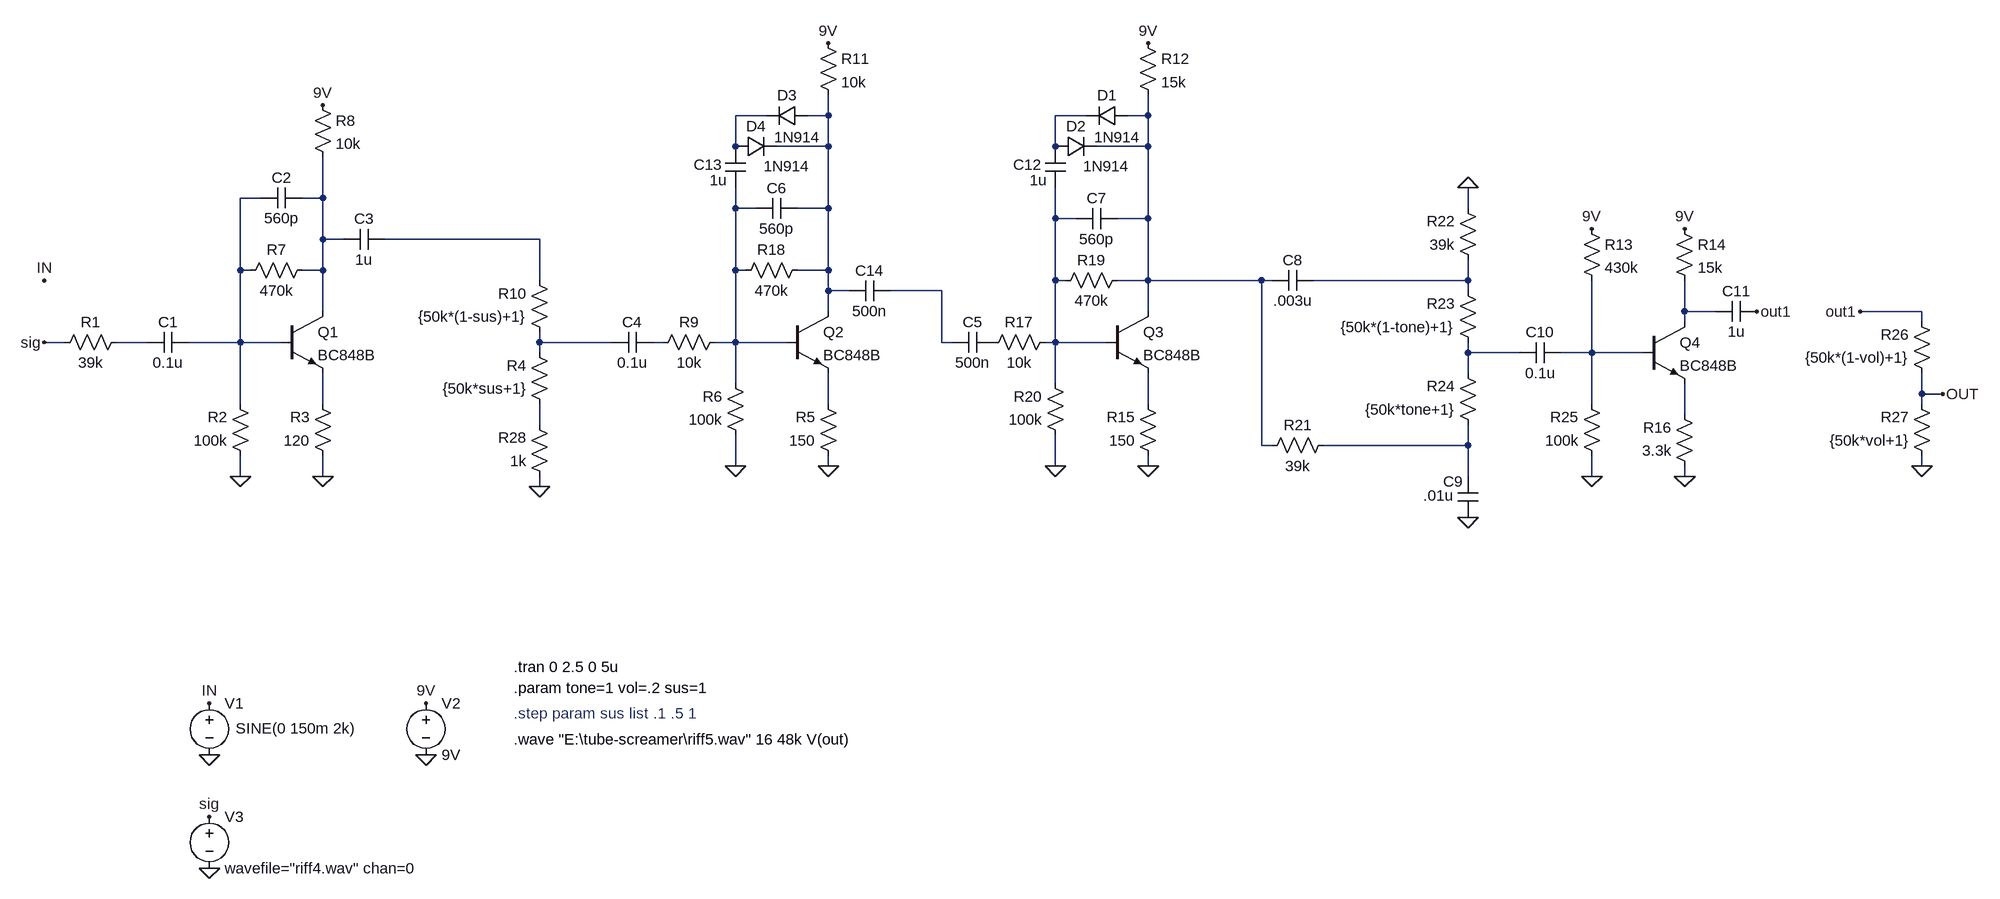
[diagram p0: schematic BigMuffPi.asc]
BigMuffPi.asc, the LTspice schematic file:
Version 4.1
SHEET 1 2532 1044
WIRE 640 -144 592 -144
WIRE 736 -144 736 -176
WIRE 736 -144 704 -144
WIRE 1136 -144 1088 -144
WIRE 1232 -144 1232 -176
WIRE 1232 -144 1200 -144
WIRE 592 -96 592 -144
WIRE 736 -96 736 -144
WIRE 736 -96 656 -96
WIRE 1088 -96 1088 -144
WIRE 1232 -96 1232 -144
WIRE 1232 -96 1152 -96
WIRE -144 -16 -176 -16
WIRE -48 -16 -48 -80
WIRE -48 -16 -80 -16
WIRE 592 0 592 -32
WIRE 624 0 592 0
WIRE 736 0 736 -96
WIRE 736 0 688 0
WIRE 1728 0 1728 -32
WIRE 1088 16 1088 -32
WIRE 1120 16 1088 16
WIRE 1232 16 1232 -96
WIRE 1232 16 1184 16
WIRE -48 48 -48 -16
WIRE -16 48 -48 48
WIRE 288 48 48 48
WIRE -176 96 -176 -16
WIRE -160 96 -176 96
WIRE -48 96 -48 48
WIRE -48 96 -80 96
WIRE 592 96 592 0
WIRE 608 96 592 96
WIRE 736 96 736 0
WIRE 736 96 688 96
WIRE 288 112 288 48
WIRE 1088 112 1088 16
WIRE 1104 112 1088 112
WIRE 1232 112 1232 16
WIRE 1232 112 1184 112
WIRE 1408 112 1232 112
WIRE 1424 112 1408 112
WIRE 1728 112 1728 80
WIRE 1728 112 1488 112
WIRE 736 128 736 96
WIRE 768 128 736 128
WIRE 912 128 832 128
WIRE 1728 128 1728 112
WIRE -48 160 -48 96
WIRE 736 160 736 128
WIRE 1232 160 1232 112
WIRE 2064 160 2064 112
WIRE 2112 160 2064 160
WIRE 2432 160 2336 160
WIRE 2064 176 2064 160
WIRE 2432 176 2432 160
WIRE -448 208 -480 208
WIRE -320 208 -368 208
WIRE -176 208 -176 96
WIRE -176 208 -256 208
WIRE -112 208 -176 208
WIRE 288 208 288 192
WIRE 400 208 288 208
WIRE 480 208 464 208
WIRE 592 208 592 96
WIRE 592 208 560 208
WIRE 672 208 592 208
WIRE 912 208 912 128
WIRE 928 208 912 208
WIRE 1088 208 1088 112
WIRE 1088 208 1072 208
WIRE 1168 208 1088 208
WIRE 288 224 288 208
WIRE 1728 224 1728 208
WIRE 1808 224 1728 224
WIRE 1920 224 1920 112
WIRE 1920 224 1872 224
WIRE 2000 224 1920 224
WIRE 1728 256 1728 224
WIRE 592 272 592 208
WIRE 1088 272 1088 208
WIRE 2432 288 2432 256
WIRE 2464 288 2432 288
WIRE -176 304 -176 208
WIRE -48 304 -48 256
WIRE 736 304 736 256
WIRE 1232 304 1232 256
WIRE 1920 304 1920 224
WIRE 2432 304 2432 288
WIRE 2064 320 2064 272
WIRE 288 336 288 304
WIRE 1408 368 1408 112
WIRE 1424 368 1408 368
WIRE 1728 368 1728 336
WIRE 1728 368 1504 368
WIRE 592 400 592 352
WIRE 736 400 736 384
WIRE 1088 400 1088 352
WIRE 1232 400 1232 384
WIRE 2432 400 2432 384
WIRE -176 416 -176 384
WIRE -48 416 -48 384
WIRE 1728 416 1728 368
WIRE 1920 416 1920 384
WIRE 2064 416 2064 400
WIRE 288 432 288 416
FLAG -176 416 0
FLAG -48 416 0
FLAG 288 432 0
FLAG -48 -160 9V
FLAG 736 -256 9V
FLAG 1232 -256 9V
FLAG 1920 32 9V
FLAG 2064 32 9V
FLAG 1232 400 0
FLAG 2064 416 0
FLAG 736 400 0
FLAG 592 400 0
FLAG 1088 400 0
FLAG 1728 -32 0
FLAG 1728 480 0
FLAG 1920 416 0
FLAG 2432 400 0
FLAG 2464 288 OUT
FLAG -480 112 IN
FLAG -224 768 IN
FLAG -224 848 0
FLAG 112 768 9V
FLAG 112 848 0
FLAG -224 1024 0
FLAG -224 944 sig
FLAG -480 208 sig
FLAG 2336 160 out1
FLAG 2176 160 out1
SYMBOL npn3 672 160 R0
SYMATTR InstName Q2
SYMATTR Value BC848B
SYMBOL npn3 1168 160 R0
SYMATTR InstName Q3
SYMATTR Value BC848B
SYMBOL npn3 2000 176 R0
SYMATTR InstName Q4
SYMATTR Value BC848B
SYMBOL res -352 192 R90
WINDOW 0 0 56 VBottom 2
WINDOW 3 32 56 VTop 2
SYMATTR InstName R1
SYMATTR Value 39k
SYMBOL res -160 400 R180
WINDOW 0 36 76 Left 2
WINDOW 3 36 40 Left 2
SYMATTR InstName R2
SYMATTR Value 100k
SYMBOL res -32 400 R180
WINDOW 0 36 76 Left 2
WINDOW 3 36 40 Left 2
SYMATTR InstName R3
SYMATTR Value 120
SYMBOL res 304 320 R180
WINDOW 0 36 76 Left 2
WINDOW 3 36 40 Left 2
SYMATTR InstName R4
SYMATTR Value {50k*sus+1}
SYMBOL res 752 400 R180
WINDOW 0 36 76 Left 2
WINDOW 3 36 40 Left 2
SYMATTR InstName R5
SYMATTR Value 150
SYMBOL res 608 368 R180
WINDOW 0 36 76 Left 2
WINDOW 3 36 40 Left 2
SYMATTR InstName R6
SYMATTR Value 100k
SYMBOL res -176 112 R270
WINDOW 0 32 56 VTop 2
WINDOW 3 0 56 VBottom 2
SYMATTR InstName R7
SYMATTR Value 470k
SYMBOL res -64 -176 R0
SYMATTR InstName R8
SYMATTR Value 10k
SYMBOL res 576 192 R90
WINDOW 0 0 56 VBottom 2
WINDOW 3 32 56 VTop 2
SYMATTR InstName R9
SYMATTR Value 10k
SYMBOL cap -256 192 R90
WINDOW 0 0 32 VBottom 2
WINDOW 3 32 32 VTop 2
SYMATTR InstName C1
SYMATTR Value 0.1u
SYMBOL cap -80 -32 R90
WINDOW 0 0 32 VBottom 2
WINDOW 3 32 32 VTop 2
SYMATTR InstName C2
SYMATTR Value 560p
SYMBOL cap 48 32 R90
WINDOW 0 0 32 VBottom 2
WINDOW 3 32 32 VTop 2
SYMATTR InstName C3
SYMATTR Value 1u
SYMBOL cap 464 192 R90
WINDOW 0 0 32 VBottom 2
WINDOW 3 32 32 VTop 2
SYMATTR InstName C4
SYMATTR Value 0.1u
SYMBOL res 304 208 R180
WINDOW 0 36 76 Left 2
WINDOW 3 36 40 Left 2
SYMATTR InstName R10
SYMATTR Value {50k*(1-sus)+1}
SYMBOL res 720 -272 R0
SYMATTR InstName R11
SYMATTR Value 10k
SYMBOL res 1216 -272 R0
SYMATTR InstName R12
SYMATTR Value 15k
SYMBOL res 1904 16 R0
SYMATTR InstName R13
SYMATTR Value 430k
SYMBOL res 2048 16 R0
SYMATTR InstName R14
SYMATTR Value 15k
SYMBOL res 1248 400 R180
WINDOW 0 36 76 Left 2
WINDOW 3 36 40 Left 2
SYMATTR InstName R15
SYMATTR Value 150
SYMBOL res 2080 416 R180
WINDOW 0 36 76 Left 2
WINDOW 3 36 40 Left 2
SYMATTR InstName R16
SYMATTR Value 3.3k
SYMBOL res 1088 192 R90
WINDOW 0 0 56 VBottom 2
WINDOW 3 32 56 VTop 2
SYMATTR InstName R17
SYMATTR Value 10k
SYMBOL cap 992 192 R90
WINDOW 0 0 32 VBottom 2
WINDOW 3 32 32 VTop 2
SYMATTR InstName C5
SYMATTR Value 500n
SYMBOL res 592 112 R270
WINDOW 0 32 56 VTop 2
WINDOW 3 0 56 VBottom 2
SYMATTR InstName R18
SYMATTR Value 470k
SYMBOL cap 688 -16 R90
WINDOW 0 0 32 VBottom 2
WINDOW 3 32 32 VTop 2
SYMATTR InstName C6
SYMATTR Value 560p
SYMBOL res 1088 128 R270
WINDOW 0 32 56 VTop 2
WINDOW 3 0 56 VBottom 2
SYMATTR InstName R19
SYMATTR Value 470k
SYMBOL cap 1184 0 R90
WINDOW 0 0 32 VBottom 2
WINDOW 3 32 32 VTop 2
SYMATTR InstName C7
SYMATTR Value 560p
SYMBOL res 1104 368 R180
WINDOW 0 36 76 Left 2
WINDOW 3 36 40 Left 2
SYMATTR InstName R20
SYMATTR Value 100k
SYMBOL res 1520 352 R90
WINDOW 0 0 56 VBottom 2
WINDOW 3 32 56 VTop 2
SYMATTR InstName R21
SYMATTR Value 39k
SYMBOL cap 1488 96 R90
WINDOW 0 0 32 VBottom 2
WINDOW 3 32 32 VTop 2
SYMATTR InstName C8
SYMATTR Value .003u
SYMBOL res 1744 96 R180
WINDOW 0 36 76 Left 2
WINDOW 3 36 40 Left 2
SYMATTR InstName R22
SYMATTR Value 39k
SYMBOL res 1744 224 R180
WINDOW 0 36 76 Left 2
WINDOW 3 36 40 Left 2
SYMATTR InstName R23
SYMATTR Value {50k*(1-tone)+1}
SYMBOL res 1744 352 R180
WINDOW 0 36 76 Left 2
WINDOW 3 36 40 Left 2
SYMATTR InstName R24
SYMATTR Value {50k*tone+1}
SYMBOL cap 1744 480 R180
WINDOW 0 24 56 Left 2
WINDOW 3 38 34 Left 2
SYMATTR InstName C9
SYMATTR Value .01u
SYMBOL cap 1872 208 R90
WINDOW 0 0 32 VBottom 2
WINDOW 3 32 32 VTop 2
SYMATTR InstName C10
SYMATTR Value 0.1u
SYMBOL res 1936 400 R180
WINDOW 0 36 76 Left 2
WINDOW 3 36 40 Left 2
SYMATTR InstName R25
SYMATTR Value 100k
SYMBOL cap 2176 144 R90
WINDOW 0 0 32 VBottom 2
WINDOW 3 32 32 VTop 2
SYMATTR InstName C11
SYMATTR Value 1u
SYMBOL res 2448 272 R180
WINDOW 0 36 76 Left 2
WINDOW 3 36 40 Left 2
SYMATTR InstName R26
SYMATTR Value {50k*(1-vol)+1}
SYMBOL res 2448 400 R180
WINDOW 0 36 76 Left 2
WINDOW 3 36 40 Left 2
SYMATTR InstName R27
SYMATTR Value {50k*vol+1}
SYMBOL diode 1200 -160 R90
WINDOW 0 0 32 VBottom 2
WINDOW 3 34 16 VTop 2
SYMATTR InstName D1
SYMATTR Value 1N914
SYMBOL diode 1088 -80 R270
WINDOW 0 32 32 VTop 2
WINDOW 3 1 79 VBottom 2
SYMATTR InstName D2
SYMATTR Value 1N914
SYMBOL cap 1072 -96 R0
WINDOW 0 -49 28 Left 2
WINDOW 3 -24 52 Left 2
SYMATTR InstName C12
SYMATTR Value 1u
SYMBOL diode 704 -160 R90
WINDOW 0 0 32 VBottom 2
WINDOW 3 34 16 VTop 2
SYMATTR InstName D3
SYMATTR Value 1N914
SYMBOL diode 592 -80 R270
WINDOW 0 32 32 VTop 2
WINDOW 3 1 79 VBottom 2
SYMATTR InstName D4
SYMATTR Value 1N914
SYMBOL cap 576 -96 R0
WINDOW 0 -49 28 Left 2
WINDOW 3 -24 52 Left 2
SYMATTR InstName C13
SYMATTR Value 1u
SYMBOL res 304 432 R180
WINDOW 0 36 76 Left 2
WINDOW 3 36 40 Left 2
SYMATTR InstName R28
SYMATTR Value 1k
SYMBOL voltage -224 752 R0
WINDOW 3 41 55 Left 2
WINDOW 123 0 0 Left 0
WINDOW 39 0 0 Left 0
SYMATTR Value SINE(0 150m 2k)
SYMATTR InstName V1
SYMBOL voltage 112 752 R0
SYMATTR InstName V2
SYMATTR Value 9V
SYMBOL voltage -224 928 R0
SYMATTR InstName V3
SYMATTR Value wavefile="riff4.wav" chan=0
SYMBOL npn3 -112 160 R0
SYMATTR InstName Q1
SYMATTR Value BC848B
SYMBOL cap 832 112 R90
WINDOW 0 0 32 VBottom 2
WINDOW 3 32 32 VTop 2
SYMATTR InstName C14
SYMATTR Value 500n
TEXT 248 744 Left 2 !.param tone=1 vol=.2 sus=1
TEXT 248 712 Left 2 !.tran 0 2.5 0 5u
TEXT 248 784 Left 2 ;.step param sus list .1 .5 1
TEXT 248 824 Left 2 !.wave "E:\\tube-screamer\\riff5.wav" 16 48k V(out)

The netlist it stands for:
* BigMuffPi.asc
Q2 N002 N007 N019 0 BC848B
Q3 N004 N008 N020 0 BC848B
Q4 N012 N017 N021 0 BC848B
R1 N013 sig 39k
R2 0 N005 100k
R3 0 N018 120
R4 N022 N014 {50k*sus+1}
R5 0 N019 150
R6 0 N007 100k
R7 N005 N006 470k
R8 9V N006 10k
R9 N007 N015 10k
C1 N005 N013 0.1u
C2 N006 N005 560p
C3 N009 N006 1u
C4 N015 N014 0.1u
R10 N014 N009 {50k*(1-sus)+1}
R11 9V N002 10k
R12 9V N004 15k
R13 9V N017 430k
R14 9V N012 15k
R15 0 N020 150
R16 0 N021 3.3k
R17 N008 P001 10k
C5 P001 N011 500n
R18 N007 N002 470k
C6 N002 N007 560p
R19 N008 N004 470k
C7 N004 N008 560p
R20 0 N008 100k
R21 N023 N004 39k
C8 N010 N004 .003u
R22 N010 0 39k
R23 N016 N010 {50k*(1-tone)+1}
R24 N023 N016 {50k*tone+1}
C9 0 N023 .01u
C10 N017 N016 0.1u
R25 0 N017 100k
C11 out1 N012 1u
R26 OUT out1 {50k*(1-vol)+1}
R27 0 OUT {50k*vol+1}
D1 N004 N003 1N914
D2 N003 N004 1N914
C12 N003 N008 1u
D3 N002 N001 1N914
D4 N001 N002 1N914
C13 N001 N007 1u
R28 0 N022 1k
V1 IN 0 SINE(0 150m 2k)
V2 9V 0 9V
V3 sig 0 wavefile="riff4.wav" chan=0
Q1 N006 N005 N018 0 BC848B
C14 N011 N002 500n
.model D D
.lib standard.dio
.model NPN NPN
.model PNP PNP
.lib standard.bjt
.param tone=1 vol=.2 sus=1
.tran 0 2.5 0 5u
* .step param sus list .1 .5 1
.wave "E:\tube-screamer\riff5.wav" 16 48k V(out)
.backanno
.end